# Altium schematic sheet Header_Sheet_2.SchDoc
size A4; SheetNumber: 8; SheetTotal: 12
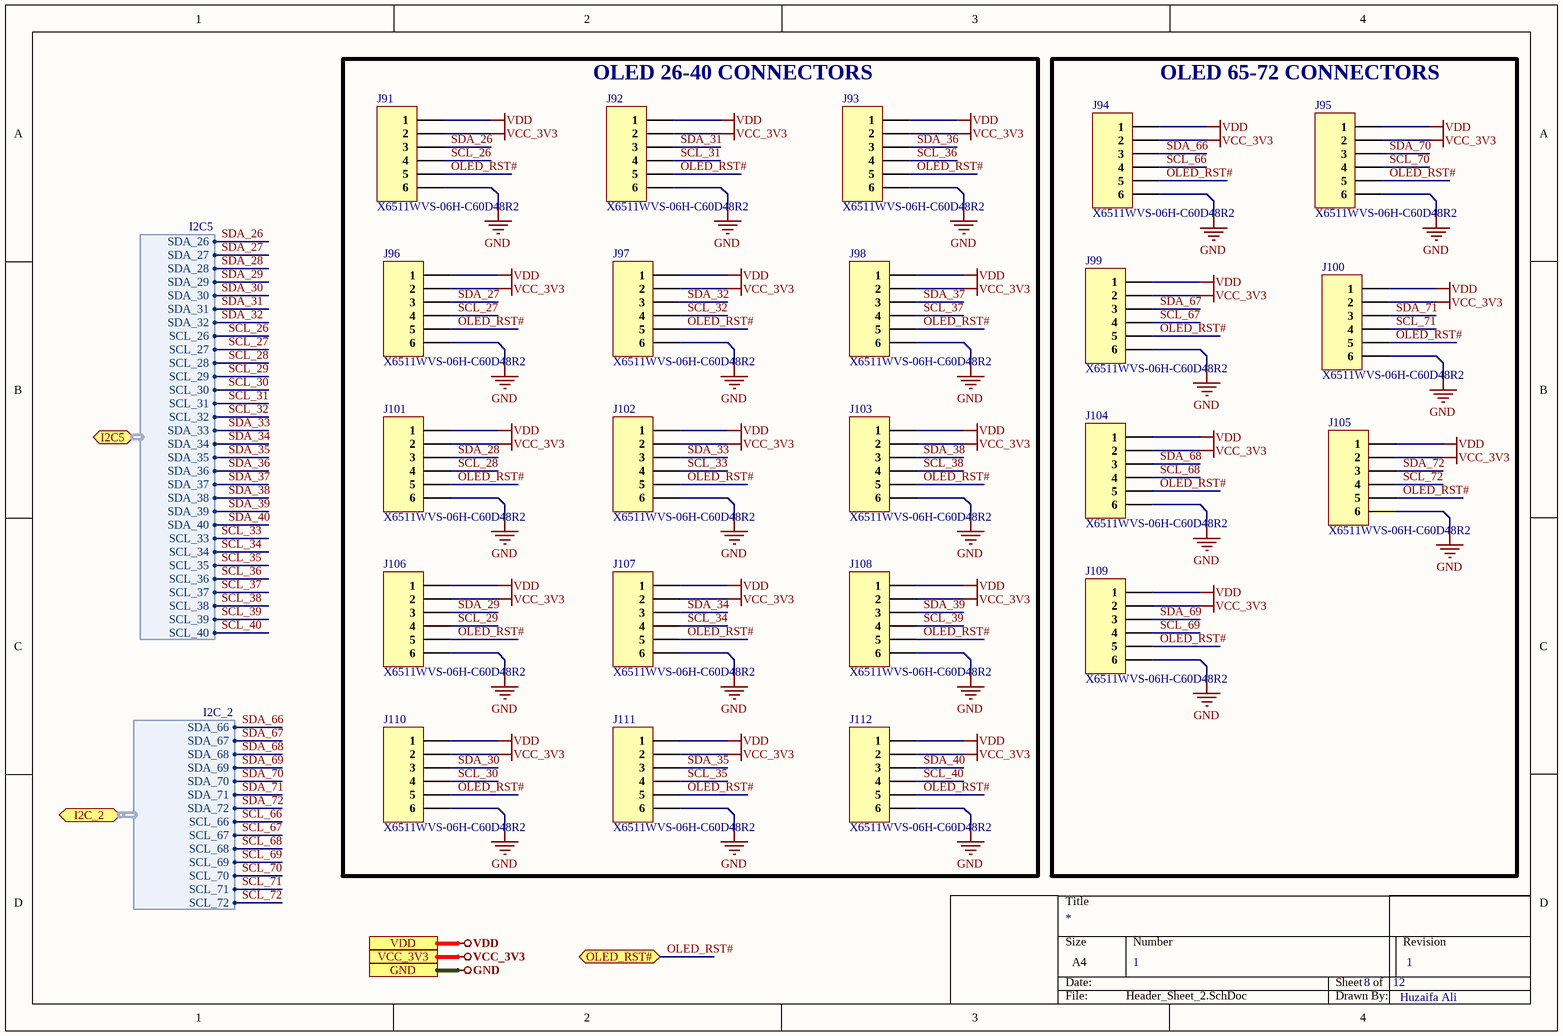
[diagram p0: Header_Sheet_2.SchDoc]

## Parts
J91  X6511WVS-06H-C60D48R2  [X6511WVS-06H-C60D48R2]
J92  X6511WVS-06H-C60D48R2  [X6511WVS-06H-C60D48R2]
J93  X6511WVS-06H-C60D48R2  [X6511WVS-06H-C60D48R2]
J94  X6511WVS-06H-C60D48R2  [X6511WVS-06H-C60D48R2]
J95  X6511WVS-06H-C60D48R2  [X6511WVS-06H-C60D48R2]
J96  X6511WVS-06H-C60D48R2  [X6511WVS-06H-C60D48R2]
J97  X6511WVS-06H-C60D48R2  [X6511WVS-06H-C60D48R2]
J98  X6511WVS-06H-C60D48R2  [X6511WVS-06H-C60D48R2]
J99  X6511WVS-06H-C60D48R2  [X6511WVS-06H-C60D48R2]
J100  X6511WVS-06H-C60D48R2  [X6511WVS-06H-C60D48R2]
J101  X6511WVS-06H-C60D48R2  [X6511WVS-06H-C60D48R2]
J102  X6511WVS-06H-C60D48R2  [X6511WVS-06H-C60D48R2]
J103  X6511WVS-06H-C60D48R2  [X6511WVS-06H-C60D48R2]
J104  X6511WVS-06H-C60D48R2  [X6511WVS-06H-C60D48R2]
J105  X6511WVS-06H-C60D48R2  [X6511WVS-06H-C60D48R2]
J106  X6511WVS-06H-C60D48R2  [X6511WVS-06H-C60D48R2]
J107  X6511WVS-06H-C60D48R2  [X6511WVS-06H-C60D48R2]
J108  X6511WVS-06H-C60D48R2  [X6511WVS-06H-C60D48R2]
J109  X6511WVS-06H-C60D48R2  [X6511WVS-06H-C60D48R2]
J110  X6511WVS-06H-C60D48R2  [X6511WVS-06H-C60D48R2]
J111  X6511WVS-06H-C60D48R2  [X6511WVS-06H-C60D48R2]
J112  X6511WVS-06H-C60D48R2  [X6511WVS-06H-C60D48R2]

## Blocks framed on the sheet
OLED 26-40 CONNECTORS: J91-J93 J96-J98 J101-J103 J106-J108 J110-J112
OLED 65-72 CONNECTORS: J94 J95 J99 J100 J104 J105 J109

## Ports
GND, I2C5 (bidir, harness I2C5), I2C_2 (bidir, harness I2C_2), OLED_RST# (bidir), VCC_3V3, VDD

## Harnesses
I2C_2: SDA_66, SDA_67, SDA_68, SDA_69, SDA_70, SDA_71, SDA_72, SCL_66, SCL_67, SCL_68, SCL_69, SCL_70, SCL_71, SCL_72
I2C5: SDA_26, SDA_27, SDA_28, SDA_29, SDA_30, SDA_31, SDA_32, SCL_26, SCL_27, SCL_28, SCL_29, SCL_30, SCL_31, SCL_32, SDA_33, SDA_34, SDA_35, SDA_36, SDA_37, SDA_38, SDA_39, SDA_40, SCL_33, SCL_34, SCL_35, SCL_36, SCL_37, SCL_38, SCL_39, SCL_40

## Nets
GND: J91.6 J92.6 J93.6 J94.6 J95.6 J96.6 J97.6 J98.6 J99.6 J100.6 J101.6 J102.6 J103.6 J104.6 J105.6 J106.6 J107.6 J108.6 J109.6 J110.6 J111.6 J112.6 ; port GND
VCC_3V3: J91.2 J92.2 J93.2 J94.2 J95.2 J96.2 J97.2 J98.2 J99.2 J100.2 J101.2 J102.2 J103.2 J104.2 J105.2 J106.2 J107.2 J108.2 J109.2 J110.2 J111.2 J112.2 ; port VCC_3V3
VDD: J91.1 J92.1 J93.1 J94.1 J95.1 J96.1 J97.1 J98.1 J99.1 J100.1 J101.1 J102.1 J103.1 J104.1 J105.1 J106.1 J107.1 J108.1 J109.1 J110.1 J111.1 J112.1 ; port VDD
OLED_RST#: J91.5 J92.5 J93.5 J94.5 J95.5 J96.5 J97.5 J98.5 J99.5 J100.5 J101.5 J102.5 J103.5 J104.5 J105.5 J106.5 J107.5 J108.5 J109.5 J110.5 J111.5 J112.5 ; port OLED_RST#
SCL_26: J91.4 ; port I2C5.SCL_26
SCL_27: J96.4 ; port I2C5.SCL_27
SCL_28: J101.4 ; port I2C5.SCL_28
SCL_29: J106.4 ; port I2C5.SCL_29
SCL_30: J110.4 ; port I2C5.SCL_30
SCL_31: J92.4 ; port I2C5.SCL_31
SCL_32: J97.4 ; port I2C5.SCL_32
SCL_33: J102.4 ; port I2C5.SCL_33
SCL_34: J107.4 ; port I2C5.SCL_34
SCL_35: J111.4 ; port I2C5.SCL_35
SCL_36: J93.4 ; port I2C5.SCL_36
SCL_37: J98.4 ; port I2C5.SCL_37
SCL_38: J103.4 ; port I2C5.SCL_38
SCL_39: J108.4 ; port I2C5.SCL_39
SCL_40: J112.4 ; port I2C5.SCL_40
SCL_66: J94.4 ; port I2C_2.SCL_66
SCL_67: J99.4 ; port I2C_2.SCL_67
SCL_68: J104.4 ; port I2C_2.SCL_68
SCL_69: J109.4 ; port I2C_2.SCL_69
SCL_70: J95.4 ; port I2C_2.SCL_70
SCL_71: J100.4 ; port I2C_2.SCL_71
SCL_72: J105.4 ; port I2C_2.SCL_72
SDA_26: J91.3 ; port I2C5.SDA_26
SDA_27: J96.3 ; port I2C5.SDA_27
SDA_28: J101.3 ; port I2C5.SDA_28
SDA_29: J106.3 ; port I2C5.SDA_29
SDA_30: J110.3 ; port I2C5.SDA_30
SDA_31: J92.3 ; port I2C5.SDA_31
SDA_32: J97.3 ; port I2C5.SDA_32
SDA_33: J102.3 ; port I2C5.SDA_33
SDA_34: J107.3 ; port I2C5.SDA_34
SDA_35: J111.3 ; port I2C5.SDA_35
SDA_36: J93.3 ; port I2C5.SDA_36
SDA_37: J98.3 ; port I2C5.SDA_37
SDA_38: J103.3 ; port I2C5.SDA_38
SDA_39: J108.3 ; port I2C5.SDA_39
SDA_40: J112.3 ; port I2C5.SDA_40
SDA_66: J94.3 ; port I2C_2.SDA_66
SDA_67: J99.3 ; port I2C_2.SDA_67
SDA_68: J104.3 ; port I2C_2.SDA_68
SDA_69: J109.3 ; port I2C_2.SDA_69
SDA_70: J95.3 ; port I2C_2.SDA_70
SDA_71: J100.3 ; port I2C_2.SDA_71
SDA_72: J105.3 ; port I2C_2.SDA_72

## Notes on the sheet
- 1
- Huzaifa Ali

## Library data of the parts
J91-J112 = X6511WVS-06H-C60D48R2: 6 POS 2.54mm SMD Header; Manufacturer: XKB Connectivity; Voltage Rating (Max): 250V; Current Rating (Max): 3A; Circluar Pins/Square Pins: Square Pins; ComponentLink1Description: LCSC; ComponentLink1URL: https://lcsc.com/product-detail/span-style-background-color-ff0-Pin-span-Headers_XKB-Connectivity-X6511WVS-06H-C60D48R2_C2883763.html; Insulation Height: 2.5mm; Length of Mating Pin: 6mm